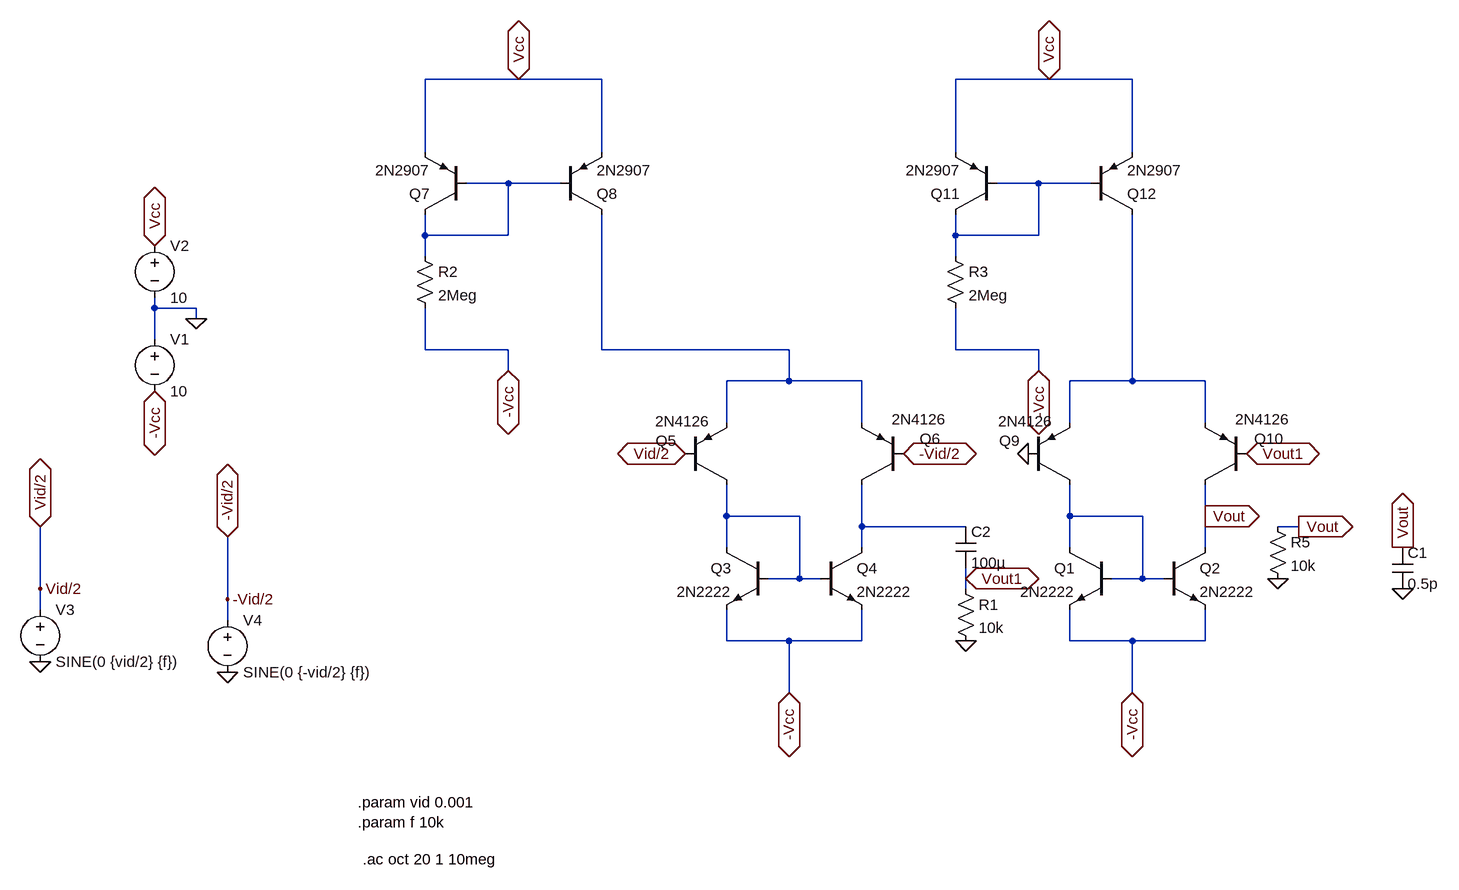
[diagram p0: schematic diff_amp_biased_by_current_mirroir.asc]
diff_amp_biased_by_current_mirroir.asc, the LTspice schematic file:
Version 4
SHEET 1 2336 816
WIRE 784 -480 640 -480
WIRE 912 -480 784 -480
WIRE 1600 -480 1456 -480
WIRE 1728 -480 1600 -480
WIRE 640 -368 640 -480
WIRE 912 -368 912 -480
WIRE 1456 -368 1456 -480
WIRE 1728 -368 1728 -480
WIRE 768 -320 704 -320
WIRE 848 -320 768 -320
WIRE 1584 -320 1520 -320
WIRE 1664 -320 1584 -320
WIRE 640 -240 640 -272
WIRE 768 -240 768 -320
WIRE 768 -240 640 -240
WIRE 1456 -240 1456 -272
WIRE 1584 -240 1584 -320
WIRE 1584 -240 1456 -240
WIRE 640 -208 640 -240
WIRE 1456 -208 1456 -240
WIRE 224 -128 224 -144
WIRE 288 -128 224 -128
WIRE 288 -112 288 -128
WIRE 224 -80 224 -128
WIRE 640 -64 640 -128
WIRE 768 -64 640 -64
WIRE 912 -64 912 -272
WIRE 1200 -64 912 -64
WIRE 1456 -64 1456 -128
WIRE 1584 -64 1456 -64
WIRE 768 -32 768 -64
WIRE 1584 -32 1584 -64
WIRE 1200 -16 1200 -64
WIRE 1200 -16 1104 -16
WIRE 1312 -16 1200 -16
WIRE 1728 -16 1728 -272
WIRE 1728 -16 1632 -16
WIRE 1840 -16 1728 -16
WIRE 1104 48 1104 -16
WIRE 1312 48 1312 -16
WIRE 1632 48 1632 -16
WIRE 1840 48 1840 -16
WIRE 1104 192 1104 144
WIRE 1216 192 1104 192
WIRE 1632 192 1632 144
WIRE 1744 192 1632 192
WIRE 1840 192 1840 144
WIRE 1312 208 1312 144
WIRE 1472 208 1312 208
WIRE 1984 208 1952 208
WIRE 1104 240 1104 192
WIRE 1312 240 1312 208
WIRE 1632 240 1632 192
WIRE 1840 240 1840 192
WIRE 1216 288 1216 192
WIRE 1216 288 1168 288
WIRE 1248 288 1216 288
WIRE 1472 288 1472 272
WIRE 1744 288 1744 192
WIRE 1744 288 1696 288
WIRE 1776 288 1744 288
WIRE 48 304 48 208
WIRE 1472 304 1472 288
WIRE 336 320 336 224
WIRE 48 336 48 304
WIRE 336 352 336 320
WIRE 1104 384 1104 336
WIRE 1200 384 1104 384
WIRE 1312 384 1312 336
WIRE 1312 384 1200 384
WIRE 1632 384 1632 336
WIRE 1728 384 1632 384
WIRE 1840 384 1840 336
WIRE 1840 384 1728 384
WIRE 1200 464 1200 384
WIRE 1728 464 1728 384
FLAG 288 -112 0
FLAG 224 0 -Vcc
IOPIN 224 0 BiDir
FLAG 224 -224 Vcc
IOPIN 224 -224 BiDir
FLAG 48 416 0
FLAG 48 304 Vid/2
FLAG 1984 208 Vout
IOPIN 1984 208 Out
FLAG 336 432 0
FLAG 336 320 -Vid/2
FLAG 48 208 Vid/2
IOPIN 48 208 BiDir
FLAG 336 224 -Vid/2
IOPIN 336 224 BiDir
FLAG 1040 96 Vid/2
IOPIN 1040 96 BiDir
FLAG 1376 96 -Vid/2
IOPIN 1376 96 BiDir
FLAG 2144 240 Vout
IOPIN 2144 240 Out
FLAG 2144 304 0
FLAG 784 -480 Vcc
IOPIN 784 -480 BiDir
FLAG 768 -32 -Vcc
IOPIN 768 -32 BiDir
FLAG 1200 464 -Vcc
IOPIN 1200 464 BiDir
FLAG 1952 288 0
FLAG 1904 96 Vout1
IOPIN 1904 96 BiDir
FLAG 1728 464 -Vcc
IOPIN 1728 464 BiDir
FLAG 1472 288 Vout1
IOPIN 1472 288 BiDir
FLAG 1840 192 Vout
IOPIN 1840 192 Out
FLAG 1568 96 0
FLAG 1472 384 0
FLAG 1600 -480 Vcc
IOPIN 1600 -480 BiDir
FLAG 1584 -32 -Vcc
IOPIN 1584 -32 BiDir
SYMBOL Voltage 224 -96 R0
SYMATTR InstName V1
SYMATTR Value 10
SYMBOL Voltage 224 -240 R0
SYMATTR InstName V2
SYMATTR Value 10
SYMBOL Voltage 48 320 R0
SYMATTR InstName V3
SYMATTR Value SINE(0 {vid/2} {f})
SYMATTR Value2 AC {vid/2}
SYMBOL npn 1168 240 M0
SYMATTR InstName Q3
SYMATTR Value 2N2222
SYMBOL npn 1248 240 R0
SYMATTR InstName Q4
SYMATTR Value 2N2222
SYMBOL pnp 1040 144 M180
WINDOW 0 -45 68 Left 2
WINDOW 3 -46 98 Left 2
SYMATTR InstName Q5
SYMATTR Value 2N4126
SYMBOL pnp 1376 144 R180
WINDOW 0 -57 71 Left 2
WINDOW 3 -67 101 Left 2
SYMATTR InstName Q6
SYMATTR Value 2N4126
SYMBOL Voltage 336 336 R0
SYMATTR InstName V4
SYMATTR Value SINE(0 {-vid/2} {f})
SYMATTR Value2 AC {-vid/2}
SYMBOL Cap 2128 240 R0
SYMATTR InstName C1
SYMATTR Value 0.5p
SYMBOL pnp 704 -272 R180
SYMATTR InstName Q7
SYMATTR Value 2N2907
SYMBOL pnp 848 -272 M180
SYMATTR InstName Q8
SYMATTR Value 2N2907
SYMBOL Res 624 -224 R0
SYMATTR InstName R2
SYMATTR Value 2Meg
SYMBOL Res 1936 192 R0
SYMATTR InstName R5
SYMATTR Value 10k
SYMBOL npn 1696 240 M0
SYMATTR InstName Q1
SYMATTR Value 2N2222
SYMBOL npn 1776 240 R0
SYMATTR InstName Q2
SYMATTR Value 2N2222
SYMBOL pnp 1568 144 M180
WINDOW 0 -45 68 Left 2
WINDOW 3 -46 98 Left 2
SYMATTR InstName Q9
SYMATTR Value 2N4126
SYMBOL pnp 1904 144 R180
WINDOW 0 -57 71 Left 2
WINDOW 3 -67 101 Left 2
SYMATTR InstName Q10
SYMATTR Value 2N4126
SYMBOL Cap 1456 208 R0
SYMATTR InstName C2
SYMATTR Value 100µ
SYMBOL Res 1456 288 R0
SYMATTR InstName R1
SYMATTR Value 10k
SYMBOL pnp 1520 -272 R180
SYMATTR InstName Q11
SYMATTR Value 2N2907
SYMBOL pnp 1664 -272 M180
SYMATTR InstName Q12
SYMATTR Value 2N2907
SYMBOL Res 1440 -224 R0
SYMATTR InstName R3
SYMATTR Value 2Meg
TEXT 536 632 Left 2 !.param vid 0.001\n.param f 10k
TEXT 544 720 Left 2 !.ac oct 20 1 10meg

The netlist it stands for:
* diff_amp_biased_by_current_mirroir.asc
V1 0 -Vcc 10
V2 Vcc 0 10
V3 Vid/2 0 SINE(0 {vid/2} {f}) AC {vid/2}
Q3 N005 N005 -Vcc 0 2N2222
Q4 N007 N005 -Vcc 0 2N2222
Q5 N005 Vid/2 N003 0 2N4126
Q6 N007 -Vid/2 N003 0 2N4126
V4 -Vid/2 0 SINE(0 {-vid/2} {f}) AC {-vid/2}
C1 Vout 0 0.5p
Q7 N001 N001 Vcc 0 2N2907
Q8 N003 N001 Vcc 0 2N2907
R2 N001 -Vcc 2Meg
R5 Vout 0 10k
Q1 N006 N006 -Vcc 0 2N2222
Q2 Vout N006 -Vcc 0 2N2222
Q9 N006 0 N004 0 2N4126
Q10 Vout Vout1 N004 0 2N4126
C2 N007 Vout1 100µ
R1 Vout1 0 10k
Q11 N002 N002 Vcc 0 2N2907
Q12 N004 N002 Vcc 0 2N2907
R3 N002 -Vcc 2Meg
.model NPN NPN
.model PNP PNP
.lib standard.bjt
.param vid 0.001
.param f 10k
.ac oct 20 1 10meg
.backanno
.end